# EasyEDA Pro project EtherCAT-RK3506.epro, schematic RK3506, sheets 11 to 12 of 12

## Sheets
11 4G: Create Date: 2026-10-26; Page Name: 4G; Schematic Name: RK3506; Update Date: 2026-10-27
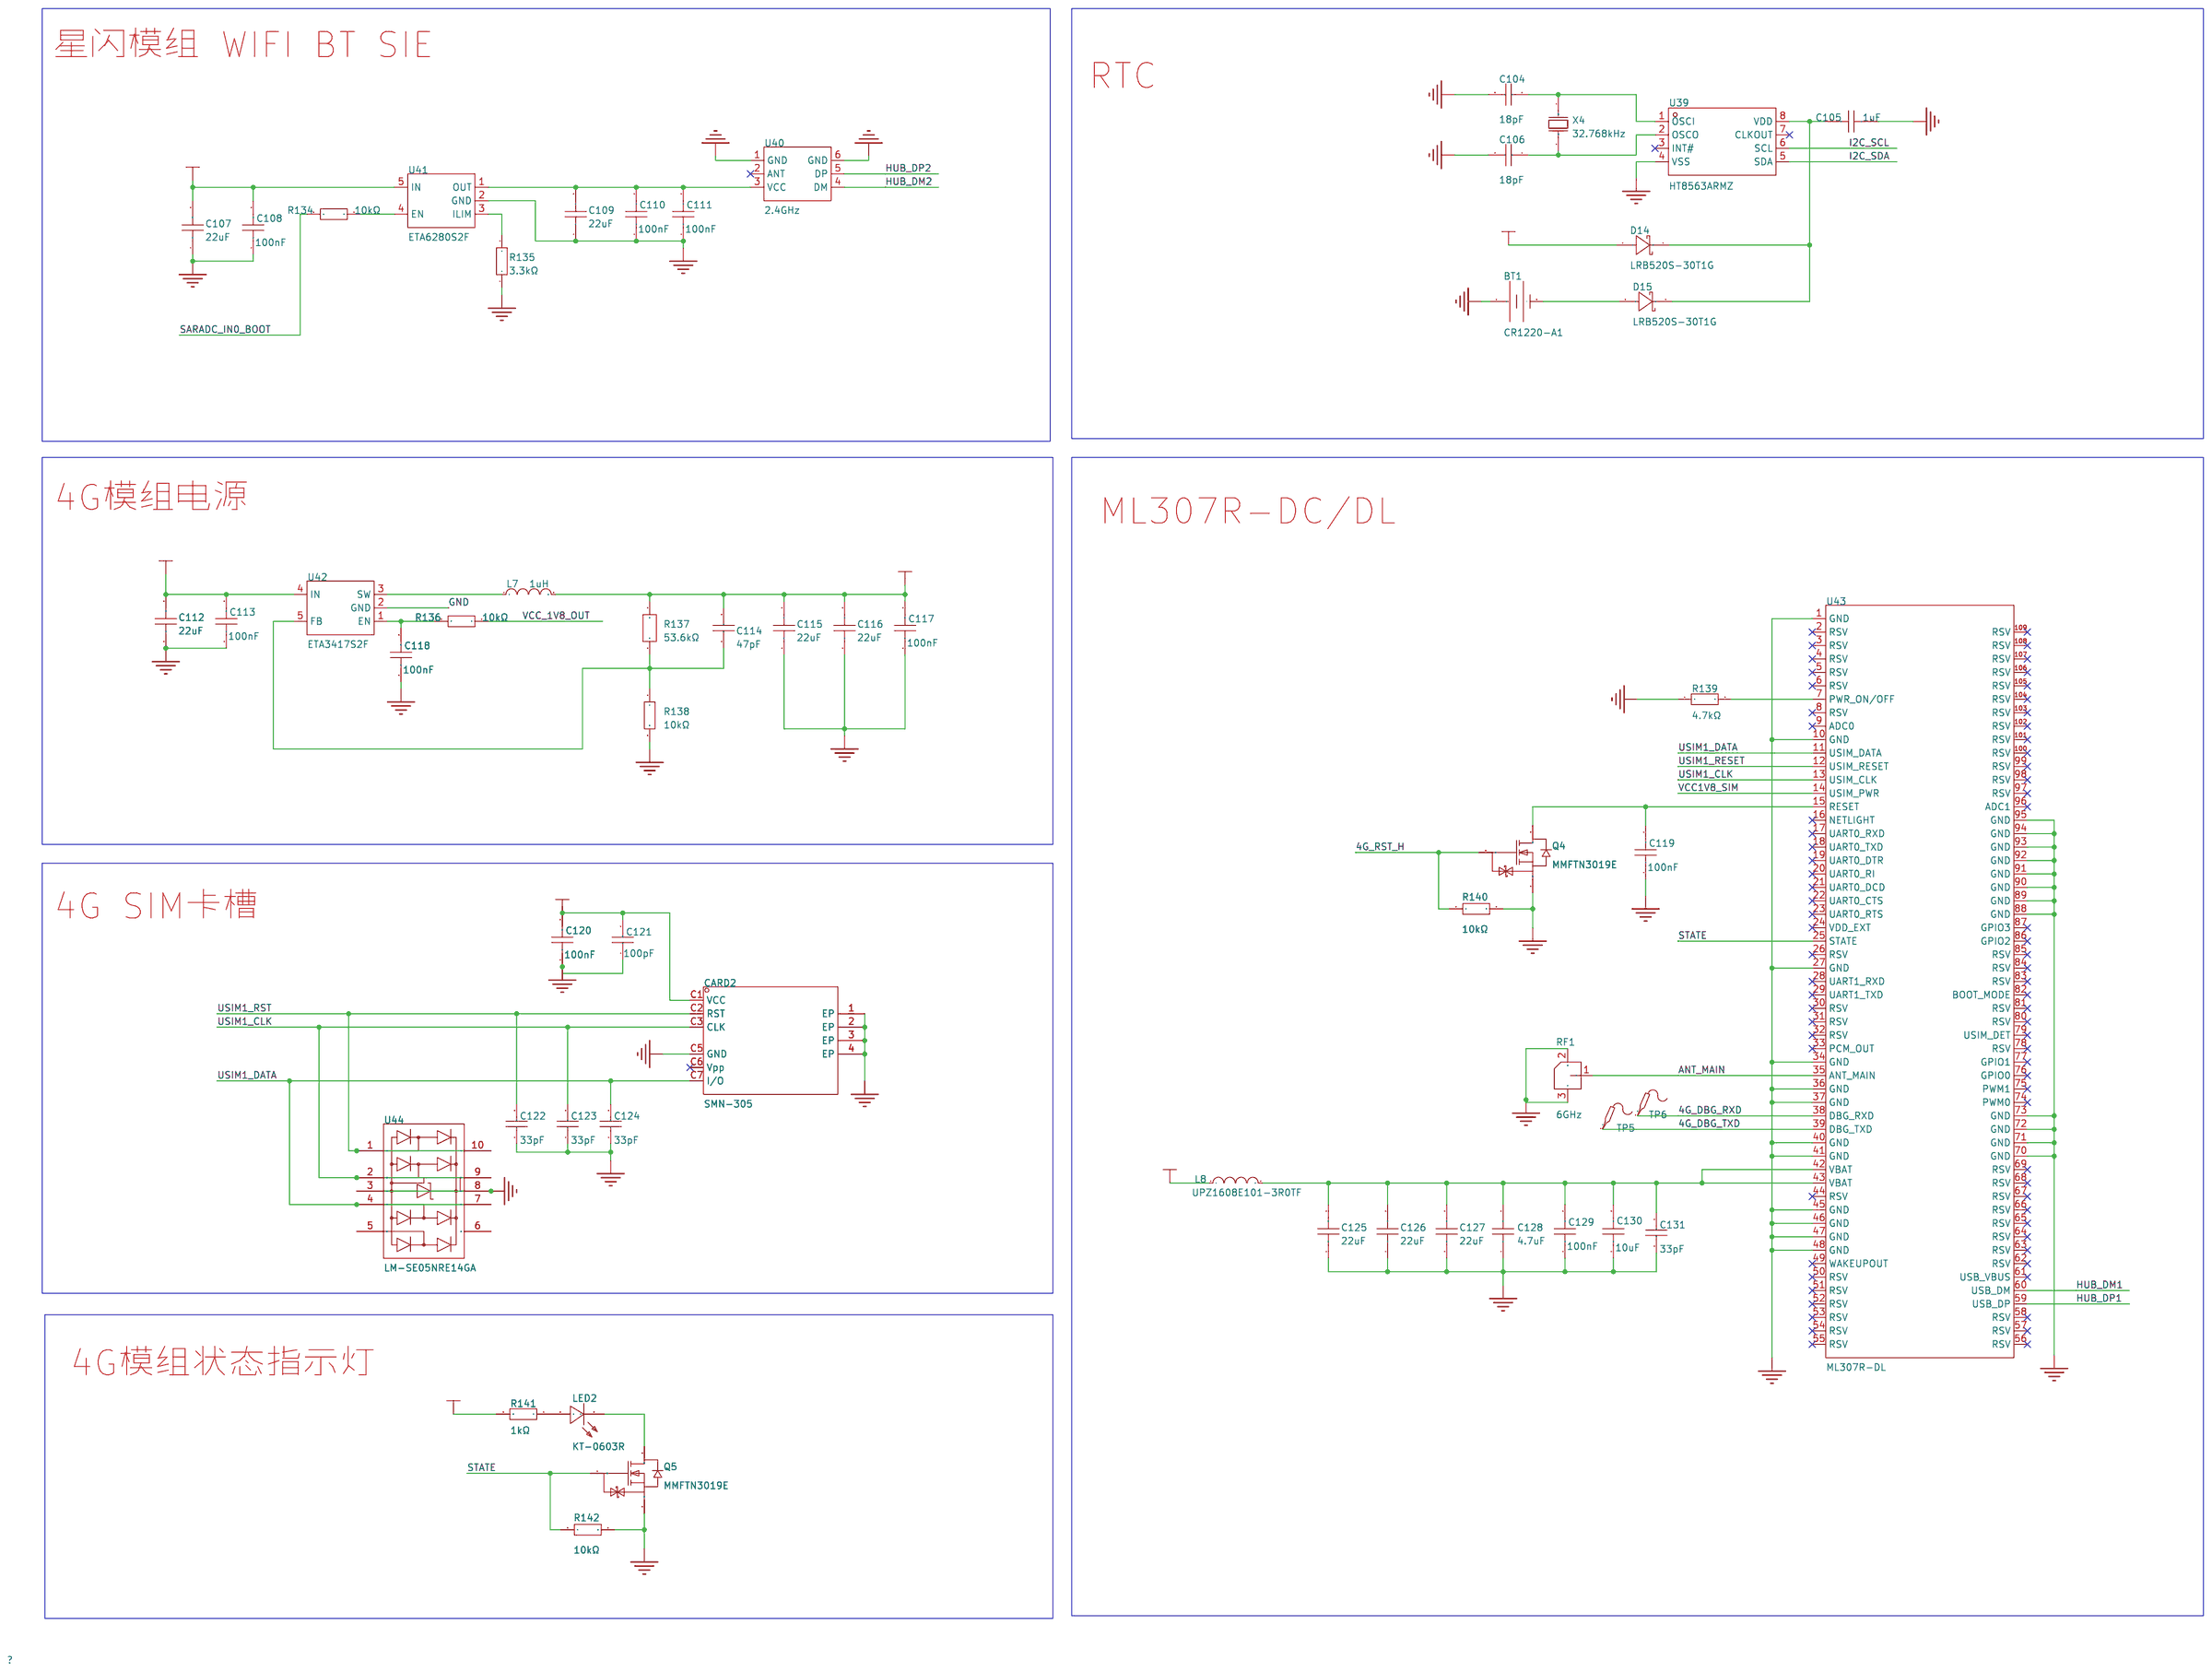
[diagram p10: 4G]
12 SD DEBUG: Create Date: 2026-10-27; Page Name: SD DEBUG; Schematic Name: RK3506; Update Date: 2026-10-27
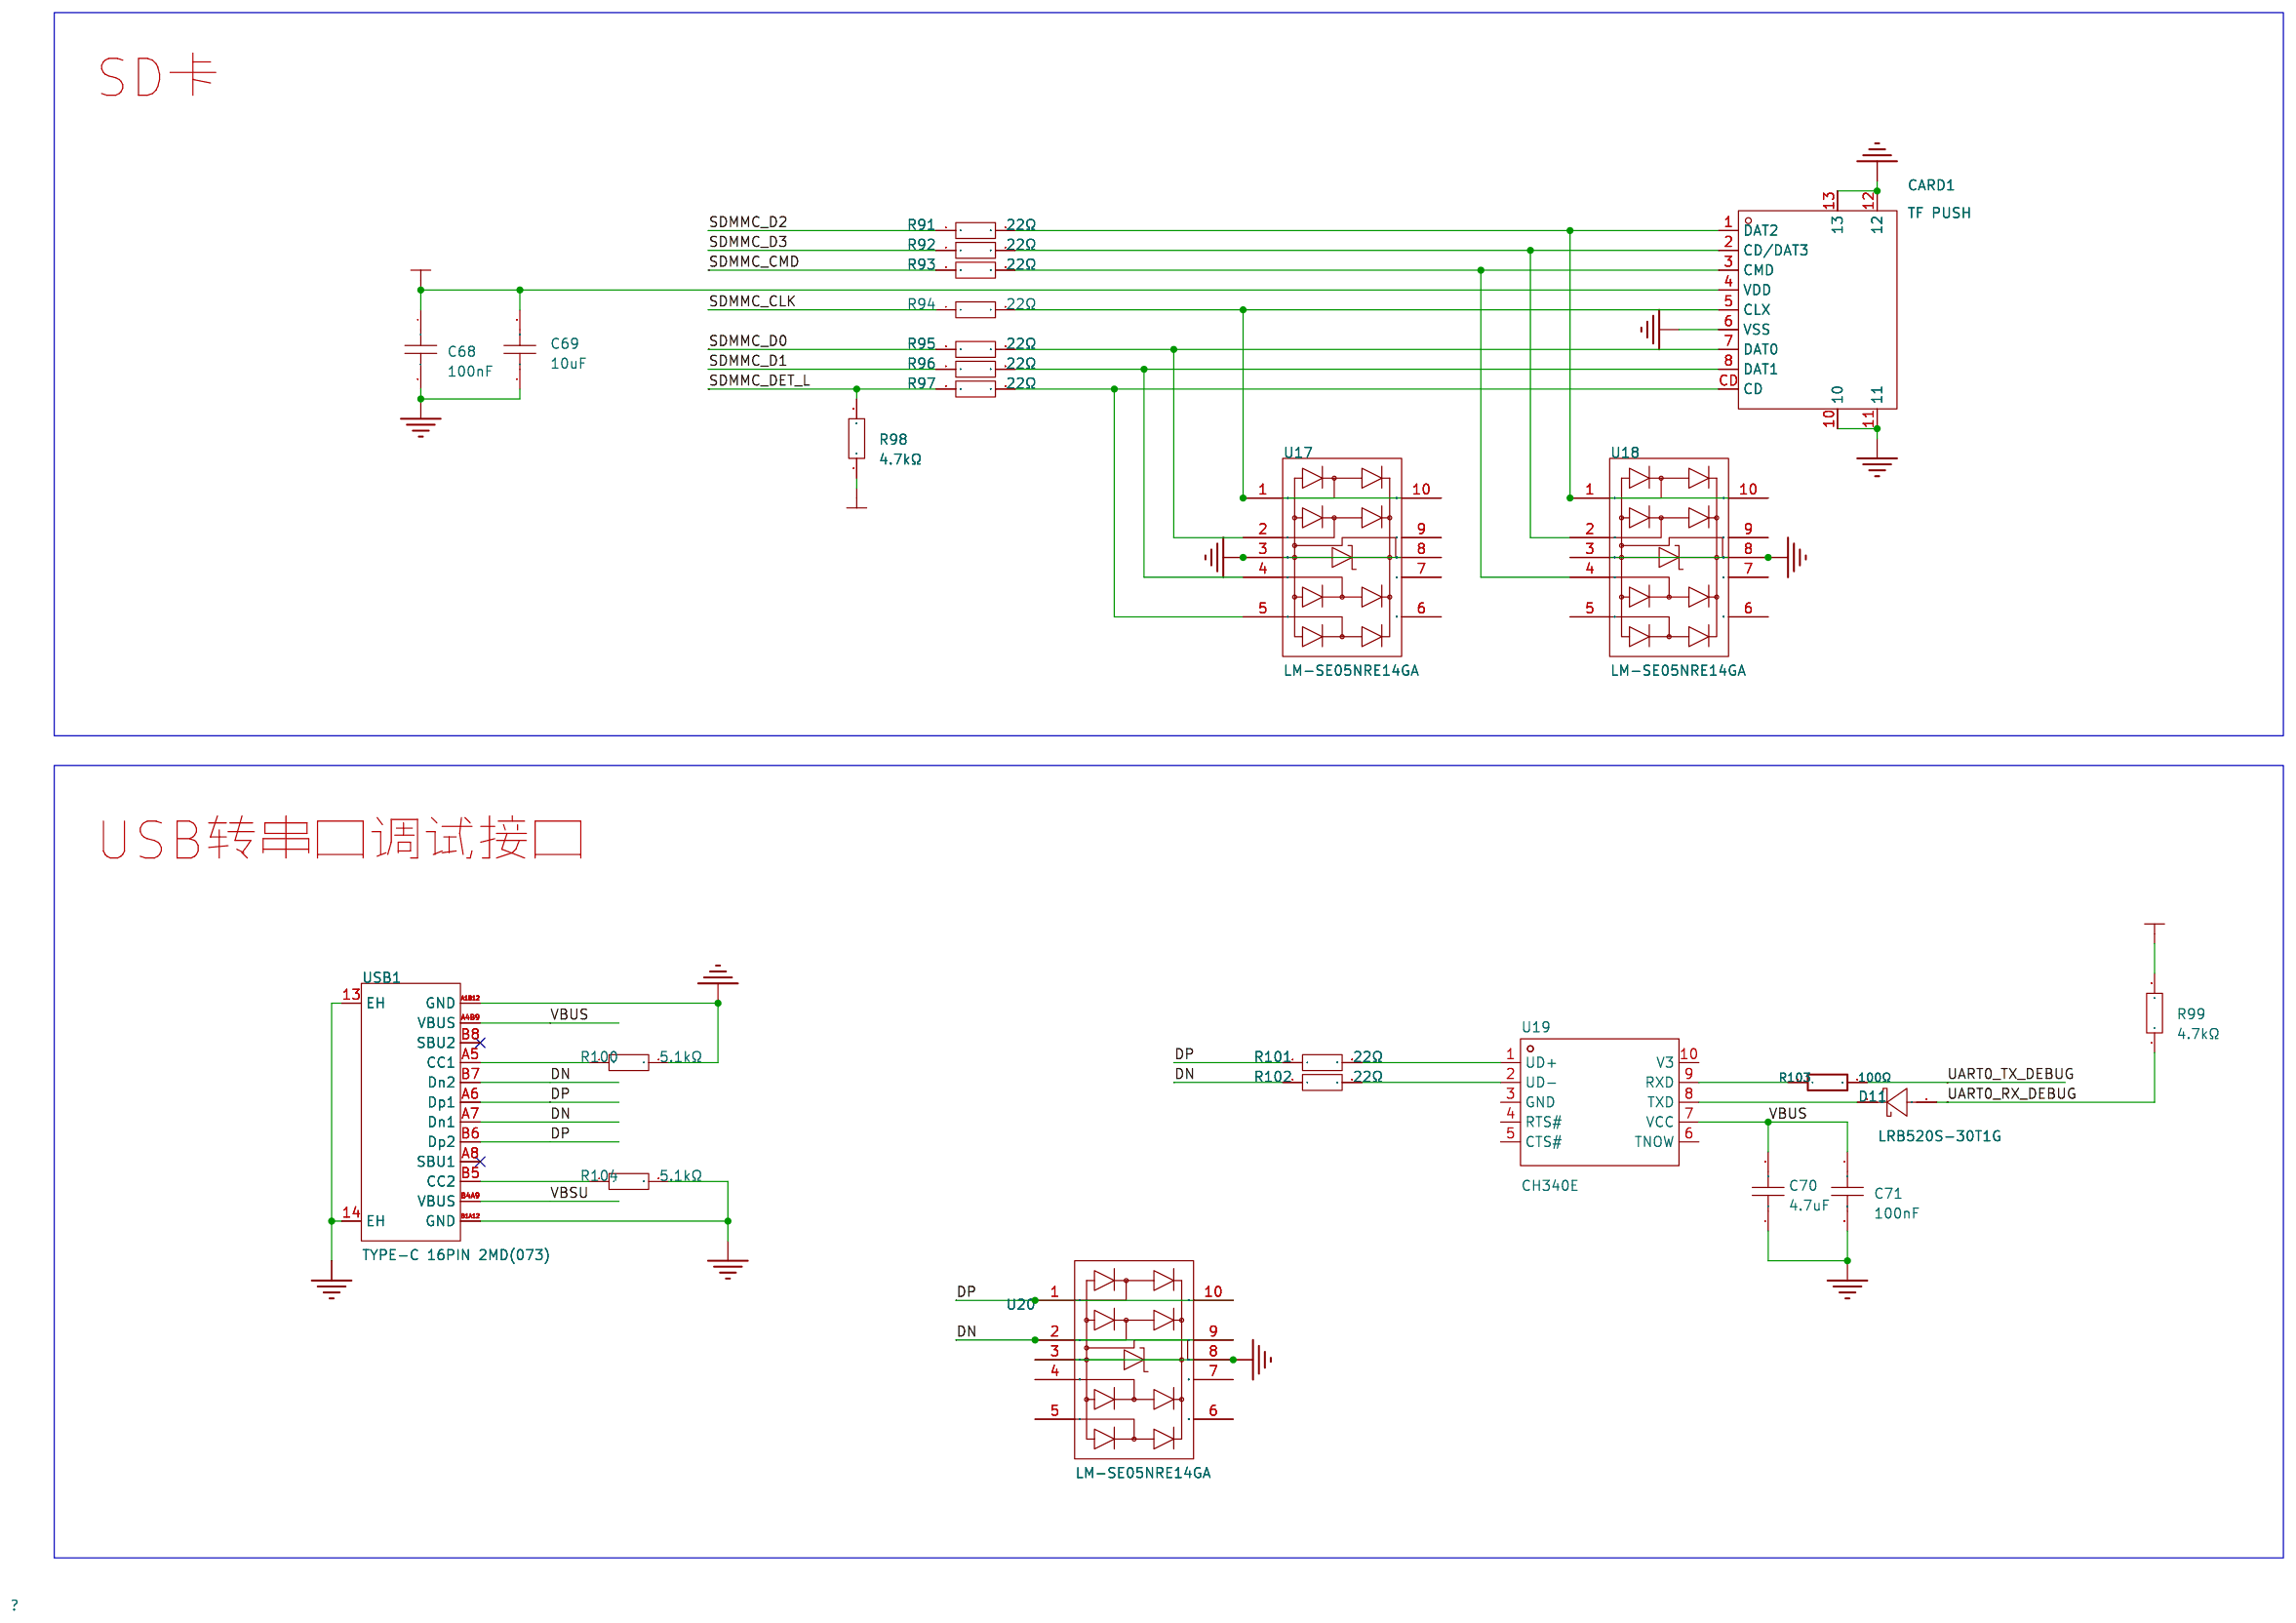
[diagram p11: SD DEBUG]

## Parts
sheet 4G
BT1  CR1220-A1  [BAT-SMD_CR1220-2]
C104  18pF  [C0402]
C105  1uF  [C0402]
C106  18pF  [C0402]
C107  22uF  [C0402]
C108  100nF  [C0402]
C109  22uF  [C0402]
C110  100nF  [C0402]
C111  100nF  [C0402]
C112  22uF  [C0402]
C113  100nF  [C0402]
C114  47pF  [C0402]
C115  22uF  [C0402]
C116  22uF  [C0402]
C117  100nF  [C0402]
C118  100nF  [C0402]
C119  100nF  [C0402]
C120  100nF  [C0402]
C121  100pF  [C0402]
C122  33pF  [C0402]
C123  33pF  [C0402]
C124  33pF  [C0402]
C125  22uF  [C0402]
C126  22uF  [C0402]
C127  22uF  [C0402]
C128  4.7uF  [C0402]
C129  100nF  [C0402]
C130  10uF  [C1206]
C131  33pF  [C0402]
CARD2  SMN-305  [SIM-SMD_SMN-305]
D14  LRB520S-30T1G  [SOD-523_L1.2-W0.8-LS1.6-RD-2]
D15  LRB520S-30T1G  [SOD-523_L1.2-W0.8-LS1.6-RD-2]
L7  1uH  [L0806]
L8  UPZ1608E101-3R0TF  [L0603]
LED2  KT-0603R  [LED-SMD_L1.6-W0.8-R-RD]
Q4  MMFTN3019E  [SOT-523-3_L1.6-W0.8-P1.00-LS1.6-BR]
Q5  MMFTN3019E  [SOT-523-3_L1.6-W0.8-P1.00-LS1.6-BR]
R134  10kΩ  [R0402]
R135  3.3kΩ  [R0402]
R136  10kΩ  [R0402]
R137  53.6kΩ  [R0402]
R138  10kΩ  [R0402]
R139  4.7kΩ  [R0402]
R140  10kΩ  [R0402]
R141  1kΩ  [R0402]
R142  10kΩ  [R0402]
RF1  6GHz  [IPEX-SMD_3P-L2.6-W2.6-LS3.0_RF1200001R]
TP5  -  [Test-Point-0.5mm]
TP6  -  [Test-Point-0.5mm]
U39  HT8563ARMZ  [MSOP-8_L3.0-W3.0-P0.65-LS4.9-BL]
U40  2.4GHz  [WIRELM-SMD_M573H-USBDG-NN]
U41  ETA6280S2F  [SOT-23-5_L3.0-W1.5-P0.95-LS2.8-BL]
U42  ETA3417S2F  [SOT-23-5_L2.9-W1.6-P0.95-LS2.8-BL]
U43  ML307R-DL  [LCC-LGA-109_L17.7-W15.8-P1.10_MC661]
U44  LM-SE05NRE14GA  [DFN2510-10_L2.5-W1.0-P0.50-BL]
X4  32.768kHz  [CRYSTAL-SMD_L3.2-W1.5-1]
sheet SD DEBUG
C68  100nF  [C0402]
C69  10uF  [C0603]
C70  4.7uF  [C0402]
C71  100nF  [C0402]
CARD1  TF PUSH  [TF-SMD_TF-PUSH]
D11  LRB520S-30T1G  [SOD-523_L1.2-W0.8-LS1.6-RD-2]
R91  22Ω  [R0402]
R92  22Ω  [R0402]
R93  22Ω  [R0402]
R94  22Ω  [R0402]
R95  22Ω  [R0402]
R96  22Ω  [R0402]
R97  22Ω  [R0402]
R98  4.7kΩ  [R0402]
R99  4.7kΩ  [R0402]
R100  5.1kΩ  [R0402]
R101  22Ω  [R0402]
R102  22Ω  [R0402]
R103  100Ω  [R0402]
R104  5.1kΩ  [R0402]
U17  LM-SE05NRE14GA  [DFN2510-10_L2.5-W1.0-P0.50-BL]
U18  LM-SE05NRE14GA  [DFN2510-10_L2.5-W1.0-P0.50-BL]
U19  CH340E  [MSOP-10_L3.0-W3.0-P0.50-LS5.0-BL]
U20  LM-SE05NRE14GA  [DFN2510-10_L2.5-W1.0-P0.50-BL]
USB1  TYPE-C 16PIN 2MD(073)  [USB-C-SMD_TYPE-C-16PIN-2MD-073]

## Library data of the parts
BT1 = CR1220-A1: Supplier Part: C48601334; Manufacturer: HanElectricity(瀚源); Supplier Footprint: SMD; JLCPCB Part Class: 扩展库; Datasheet: https://item.szlcsc.com/datasheet/CR1220-A1/50871511.html; Supplier: LCSC
C104 C106 = 0402CG180J500NT: 容值:18pF;精度:±5%;额定电压:50V;温度系数:C0G;; LCSC Part Name: 18pF ±5% 50V; Supplier Part: C1549; Manufacturer: FH(风华); Supplier Footprint: 0402; JLCPCB Part Class: 基础库; Datasheet: https://item.szlcsc.com/datasheet/0402CG180J500NT/1901.html; Supplier: LCSC; Tolerance: ±5%; Voltage Rating: 50V; Temperature Coefficient: C0G
C105 = CL05A105KA5NQNC: 容值:1uF;精度:±10%;额定电压:25V;温度系数:X5R;; LCSC Part Name: 1uF ±10% 25V; Supplier Part: C52923; Manufacturer: SAMSUNG(三星); Supplier Footprint: 0402; JLCPCB Part Class: 基础库; Datasheet: https://item.szlcsc.com/datasheet/CL05A105KA5NQNC/53938.html; Supplier: LCSC; Tolerance: ±10%; Voltage Rating: 25V; Temperature Coefficient: X5R
C107 C109 C112 C115 C116 C125-C127 = HGC0402R5226M100NTEJ: 容值:22uF;精度:±20%;额定电压:10V;温度系数:X5R;; LCSC Part Name: 22uF ±20% 10V; Supplier Part: C22367823; Manufacturer: Chinocera(华瓷); Supplier Footprint: 0402; JLCPCB Part Class: 扩展库; Datasheet: https://item.szlcsc.com/datasheet/HGC0402R5226M100NTEJ/23841128.html; Supplier: LCSC; Tolerance: ±20%; Voltage Rating: 10V; Temperature Coefficient: X5R
C68 C71 C108 C110 C111 C113 C117-C120 C129 = FCC0402B104K160AT: 容值:100nF;精度:±10%;额定电压:16V;温度系数:X7R;; LCSC Part Name: 100nF ±10% 16V; Supplier Part: C5137468; Manufacturer: FOJAN(富捷); Supplier Footprint: 0402; JLCPCB Part Class: 扩展库; Datasheet: https://item.szlcsc.com/datasheet/FCC0402B104K160AT/5746970.html; Supplier: LCSC; Tolerance: ±10%; Voltage Rating: 16V; Temperature Coefficient: X7R; Operating Temperature: -55℃~+125℃
C114 = 0402CG470J500NT: 容值:47pF;精度:±5%;额定电压:50V;温度系数:C0G;; LCSC Part Name: 47pF ±5% 50V; Supplier Part: C1567; Manufacturer: FH(风华); Supplier Footprint: 0402; JLCPCB Part Class: 基础库; Datasheet: https://item.szlcsc.com/datasheet/0402CG470J500NT/1919.html; Supplier: LCSC; Tolerance: ±5%; Voltage Rating: 50V; Temperature Coefficient: C0G
C121 = 0402CG101J500NT: 容值:100pF;精度:±5%;额定电压:50V;温度系数:C0G;; LCSC Part Name: 100pF ±5% 50V; Supplier Part: C1546; Manufacturer: FH(风华); Supplier Footprint: 0402; JLCPCB Part Class: 基础库; Datasheet: https://item.szlcsc.com/datasheet/0402CG101J500NT/1898.html; Supplier: LCSC; Tolerance: ±5%; Voltage Rating: 50V; Temperature Coefficient: C0G
C122-C124 C131 = 0402CG330J500NT: 容值:33pF;精度:±5%;额定电压:50V;温度系数:C0G;; LCSC Part Name: 33pF ±5% 50V; Supplier Part: C1562; Manufacturer: FH(风华); Supplier Footprint: 0402; JLCPCB Part Class: 基础库; Datasheet: https://item.szlcsc.com/datasheet/0402CG330J500NT/1914.html; Supplier: LCSC; Tolerance: ±5%; Voltage Rating: 50V; Temperature Coefficient: C0G
C70 C128 = CL05A475MP5NRNC: 容值:4.7uF;精度:±20%;额定电压:10V;温度系数:X5R;; LCSC Part Name: 4.7uF ±20% 10V; Supplier Part: C23733; Manufacturer: SAMSUNG(三星); Supplier Footprint: 0402; JLCPCB Part Class: 基础库; Datasheet: https://item.szlcsc.com/datasheet/CL05A475MP5NRNC/24469.html; Supplier: LCSC; Tolerance: ±20%; Voltage Rating: 10V; Temperature Coefficient: X5R
C130 = FCC1206X106K500HT: 容值:10uF;精度:±10%;额定电压:50V;温度系数:X5R;; LCSC Part Name: 10uF ±10% 50V; Supplier Part: C7467044; Manufacturer: FOJAN(富捷); Supplier Footprint: 1206; JLCPCB Part Class: 扩展库; Datasheet: https://item.szlcsc.com/datasheet/FCC1206X106K500HT/8513631.html; Supplier: LCSC; Tolerance: ±10%; Voltage Rating: 50V; Temperature Coefficient: X5R; Operating Temperature: -55℃~+85℃
CARD2 = SMN-305: 卡连接方式:翻盖式;卡类型:NanoSIM卡;连接器类型:卡座;本体最大高度:1.4mm;工作温度:-25℃~+85℃;; LCSC Part Name: 翻盖式 NanoSIM卡 卡座; Supplier Part: C266890; Manufacturer: XUNPU(讯普); Supplier Footprint: SMD; JLCPCB Part Class: 扩展库; Datasheet: https://item.szlcsc.com/datasheet/SMN-305/257001.html; Supplier: LCSC; Card Connection Mode: 翻盖式; Card Type: NanoSIM卡; Connector Type: 卡座; Card Detection: 无插卡检测; Height Above Board: 1.4mm; Rated Voltage (Max): 50V; Length: 14mm; Width: 12mm; Operating Temperature: -25℃~+85℃
D11 D14 D15 = LRB520S-30T1G_C52204749: 二极管配置:1个独立式;正向压降(Vf):600mV@200mA;直流反向耐压(Vr):30V;整流电流:200mA;; LCSC Part Name: 肖特基势垒二极管，适用于低电流整流和高速开关，表面贴装型，采用硅外延平面结构，开关速度快、正向电压低、反向电流小; Supplier Part: C52204749; Manufacturer: LRC(乐山无线电); Supplier Footprint: SOD-523; JLCPCB Part Class: 扩展库; Datasheet: https://item.szlcsc.com/datasheet/LRB520S-30T1G/55045632.html; Supplier: LCSC; Diode Configuration: 1个独立式; Voltage - Forward(Vf@If): 600mV@200mA; Voltage - DC Reverse(Vr): 30V; Current - Rectified: 200mA; Reverse Leakage Current (Ir): 1uA@10V; Non-Repetitive Peak Forward Surge Current: 1A
L7 = DFE201612E-1R0M=P2: 电感值:1uH;精度:±20%;额定电流:2.9A;饱和电流(Isat):4A;类型:-;; LCSC Part Name: 1uH ±20% 4A; Supplier Part: C337892; Manufacturer: muRata(村田); Supplier Footprint: 0806; JLCPCB Part Class: 扩展库; Datasheet: https://item.szlcsc.com/datasheet/DFE201612E-1R0M%253DP2/315672.html; Supplier: LCSC; Tolerance: ±20%; Current Rating: 2.9A; Current - Saturation(Isat): 4A; DC Resistance(DCR): 48mΩ
L8 = UPZ1608E101-3R0TF: 阻抗@频率:100Ω@100MHz;误差:±25%;直流电阻(DCR):30mΩ;; LCSC Part Name: 单路 0603磁珠 阻抗100Ω@100MHz; Supplier Part: C96995; Manufacturer: Sunlord(顺络); Supplier Footprint: 0603; JLCPCB Part Class: 扩展库; Datasheet: https://item.szlcsc.com/datasheet/UPZ1608E101-3R0TF/98200.html; Supplier: LCSC; Impedance @ Frequency: 100Ω@100MHz; Tolerance: ±25%; DC Resistance(DCR): 30mΩ; Current Rating: 3A; Number of Circuits: 1; Operating Temperature: -55℃~+125℃
LED2 = KT-0603R: 灯头类型:1.6mmx0.8mm方形灯头;发光颜色:红色;正向压降(Vf):1.8V~2.4V;功率:40mW;正向电流:20mA;波长:615nm~630nm;二极管配置:独立二极管;透镜颜色:无色透明透镜;色温:-;发光强度:300mcd;发光角度:120°;载带方式:-;工作温度:-40℃~+85℃;; LCSC Part Name: 0603 红灯 高亮; Supplier Part: C2286; Manufacturer: KENTO; Supplier Footprint: 0603; JLCPCB Part Class: 基础库; Datasheet: https://item.szlcsc.com/datasheet/KT-0603R/2659.html; Supplier: LCSC; Lamp Holder Type: 1.6mmx0.8mm方形灯头; Illumination Color: 红色; Voltage - Forward(Vf): 1.8V~2.4V; Power(Watts): 40mW; Forward Current: 20mA; Wavelength - Dominant: 615nm~630nm; Peak Wavelength: 645nm; Diode Configuration: 独立二极管; Lens Color: 无色透明透镜; Luminous Intensity: 300mcd; Viewing Angle: 120°; Operating Temperature: -40℃~+85℃
Q4 Q5 = MMFTN3019E: 数量:1个N沟道;漏源电压(Vdss):30V;连续漏极电流(Id):100mA;导通电阻(RDS(on)):8Ω@4V;耗散功率(Pd):150mW;阈值电压(Vgs(th)):1.5V;; LCSC Part Name: 1个N沟道 耐压:30V 电流:100mA; Supplier Part: C86709; Manufacturer: ST(先科); Supplier Footprint: SOT-523-3; JLCPCB Part Class: 扩展库; Datasheet: https://item.szlcsc.com/datasheet/MMFTN3019E/87886.html; Supplier: LCSC; Number: 1个N沟道; Drain to Source Voltage: 30V; Current - Continuous Drain(Id): 100mA; RDS(on): 8Ω@4V; Pd - Power Dissipation: 150mW; Gate Threshold Voltage (Vgs(th)): 1.5V; Input Capacitance(Ciss): 13pF; Reverse Transfer Capacitance (Crss@Vds): 4pF; Type: N沟道; Output Capacitance(Coss): 9pF; Vgs: ±20V
R134 R136 R138 R140 R142 = 0402WGF1002TCE: 电阻类型:厚膜电阻;阻值:10kΩ;精度:±1%;功率:62.5mW;工作电压:50V;温度系数:±100ppm/℃;; LCSC Part Name: 厚膜电阻 10kΩ ±1%; Supplier Part: C25744; Manufacturer: UNI-ROYAL(厚声); Supplier Footprint: 0402; JLCPCB Part Class: 基础库; Datasheet: https://item.szlcsc.com/datasheet/0402WGF1002TCE/26487.html; Supplier: LCSC; Type: 厚膜电阻; Tolerance: ±1%; Power(Watts): 62.5mW; Voltage-Supply(Max): 50V; Temperature Coefficient: ±100ppm/℃; Operating Temperature: -55℃~+155℃
R135 = 0402WGF3301TCE: 电阻类型:厚膜电阻;阻值:3.3kΩ;精度:±1%;功率:62.5mW;工作电压:50V;温度系数:±100ppm/℃;; LCSC Part Name: 厚膜电阻 3.3kΩ ±1%; Supplier Part: C25890; Manufacturer: UNI-ROYAL(厚声); Supplier Footprint: 0402; JLCPCB Part Class: 基础库; Datasheet: https://item.szlcsc.com/datasheet/0402WGF3301TCE/26633.html; Supplier: LCSC; Type: 厚膜电阻; Tolerance: ±1%; Power(Watts): 62.5mW; Voltage-Supply(Max): 50V; Temperature Coefficient: ±100ppm/℃; Operating Temperature: -55℃~+155℃
R137 = FRC0402F5362TS: 电阻类型:厚膜电阻;阻值:53.6kΩ;精度:±1%;功率:62.5mW;工作电压:50V;温度系数:±100ppm/℃;; LCSC Part Name: 53.6kΩ ±1% 62.5mW 厚膜电阻; Supplier Part: C5153961; Manufacturer: FOJAN(富捷); Supplier Footprint: 0402; JLCPCB Part Class: 扩展库; Datasheet: https://item.szlcsc.com/datasheet/FRC0402F5362TS/5781089.html; Supplier: LCSC; Type: 厚膜电阻; Tolerance: ±1%; Power(Watts): 62.5mW; Voltage-Supply(Max): 50V; Temperature Coefficient: ±100ppm/℃; Operating Temperature: -55℃~+155℃
R98 R99 R139 = 0402WGF4701TCE: 电阻类型:厚膜电阻;阻值:4.7kΩ;精度:±1%;功率:62.5mW;工作电压:50V;温度系数:±100ppm/℃;; LCSC Part Name: 厚膜电阻 4.7kΩ ±1%; Supplier Part: C25900; Manufacturer: UNI-ROYAL(厚声); Supplier Footprint: 0402; JLCPCB Part Class: 基础库; Datasheet: https://item.szlcsc.com/datasheet/0402WGF4701TCE/26643.html; Supplier: LCSC; Type: 厚膜电阻; Tolerance: ±1%; Power(Watts): 62.5mW; Voltage-Supply(Max): 50V; Temperature Coefficient: ±100ppm/℃; Operating Temperature: -55℃~+155℃
R141 = 0402WGF1001TCE: 电阻类型:厚膜电阻;阻值:1kΩ;精度:±1%;功率:62.5mW;工作电压:50V;温度系数:±100ppm/℃;; LCSC Part Name: 厚膜电阻 1kΩ ±1%; Supplier Part: C11702; Manufacturer: UNI-ROYAL(厚声); Supplier Footprint: 0402; JLCPCB Part Class: 基础库; Datasheet: https://item.szlcsc.com/datasheet/0402WGF1001TCE/12256.html; Supplier: LCSC; Type: 厚膜电阻; Tolerance: ±1%; Power(Watts): 62.5mW; Voltage-Supply(Max): 50V; Temperature Coefficient: ±100ppm/℃; Operating Temperature: -55℃~+155℃
RF1 = IPEX-1_C47986640: 连接器类型:板端;接口类型:内针;端口数量:1;接口直径:2mm;接口长度/高度:1.25mm;频率:6GHz;射频系列:IPEX;阻抗:50Ω;工作温度:-40℃~+85℃;; LCSC Part Name: 内针 IPEX; Supplier Part: C47986640; Manufacturer: HanElectricity(瀚源); Manufacturer Part: IPEX-1; Supplier Footprint: SMD; JLCPCB Part Class: 扩展库; Datasheet: https://item.szlcsc.com/datasheet/IPEX-1/50223057.html; Supplier: LCSC; Connector Type: 板端; Interface: 内针; Number of Ports: 1; Interface Diameter: 2mm; Interface Length/Height: 1.25mm; RF Series: IPEX; Impedance: 50Ω; Rated Voltage (Max): 60V; Operating Temperature Range: -40℃~+85℃
TP5 TP6 = Test-Point: Test Point 测试点
U39 = HT8563ARMZ: 接口类型:I2C;晶振类型:外置;闹钟输出:有;; LCSC Part Name: CMOS实时时钟/日历; Supplier Part: C5143012; Manufacturer: HTCSEMI(海天芯); Supplier Footprint: MSOP-8; JLCPCB Part Class: 扩展库; Datasheet: https://item.szlcsc.com/datasheet/HT8563ARMZ/5761262.html; Supplier: LCSC; Interface: I2C; crystal oscillator: 外置; Alarm Output: 有; Current - Supply: 450nA; Voltage - Supply: 1.8V~5.5V; Quiescent Current(Iq): 0.45uA; Operating Temperature: -40℃~+85℃; Features: 倒数计时器；告警功能；电池低压检测；周期性中断输出；可编程时钟输出
U40 = M573H-USBDG-NN: 频率:2.4GHz;发射功率:16dBm;接收灵敏度:-88dBm;; LCSC Part Name: 星闪模组; Supplier Part: C54321644; Manufacturer: 如般微; Supplier Footprint: SMD,13x12mm; JLCPCB Part Class: 扩展库; Datasheet: https://item.szlcsc.com/datasheet/M573H-USBDG-NN/57612387.html; Supplier: LCSC; Wireless Standard: IEEE802.11b/g/n/ax；Bluetooth5.2；SLE1.0; Interface Type: USB; Output Power: 16dBm; Voltage - Supply: 3V~3.6V; Sensitivity: -88dBm; Operating Temperature: -35℃~+70℃
U41 = ETA6280S2F: 类型:负载开关;通道数:1;输入控制逻辑:高电平有效;工作电压:2.1V~6V;最大连续电流:2.2A;导通电阻:70mΩ;; LCSC Part Name: 可编程电流限制负载开关; Supplier Part: C7465543; Manufacturer: ETA(钰泰); Supplier Footprint: SOT23-5; JLCPCB Part Class: 扩展库; Datasheet: https://item.szlcsc.com/datasheet/ETA6280S2F/8507080.html; Supplier: LCSC; Type: 负载开关; Number of Channels: 1; Control Input Logic: 高电平有效; Voltage - Supply: 2.1V~6V; Maximum Continuous Current: 2.2A; RDS(on): 70mΩ; Features: 过温保护；过流保护；短路保护；反向电流阻断；输出放电功能；过压保护；欠压锁定; Operating Temperature	-: -40℃~+85℃
U42 = ETA3417S2F: 功能类型:降压型;工作电压:2.6V~7V;输出电压:600mV~7V;输出电流:2.5A;输出类型:可调;; LCSC Part Name: 降压型 2.5A 2.6V~7V; Supplier Part: C7465507; Manufacturer: ETA(钰泰); Supplier Footprint: SOT23-5; JLCPCB Part Class: 扩展库; Datasheet: https://item.szlcsc.com/datasheet/ETA3417S2F/8507044.html; Supplier: LCSC; Function: 降压型; Voltage - Supply: 2.6V~7V; Output Voltage: 600mV~7V; Output Current: 2.5A; Frequency - Switching: 3MHz; Operating Temperature: -40℃~+85℃; Synchronous Rectifier: 是; Number of Outputs: 1; Topology: 降压式; Quiescent Current: 32uA; Switch tube (built-in/external): 内置; Output Type: 可调; Features: 逐波限流；过流保护；EMI优化(抖频模式)
U43 = ML307R-DL_C48982537: 通信制式:TDD-LTE；FDD-LTE;接口类型:PWM；UART；USB；GPIO；ADC;工作频段:B40；B34；B3；B5；B41；B39；B8；B38；B1;; LCSC Part Name: LTE Cat.1模组; Supplier Part: C48982537; Manufacturer: Chinamobile(中移物联网); Supplier Footprint: SMD,17.7x15.8mm; JLCPCB Part Class: 扩展库; Datasheet: https://item.szlcsc.com/datasheet/ML307R-DL/51313686.html; Supplier: LCSC; Communication System: TDD-LTE；FDD-LTE; Interface: PWM；UART；USB；GPIO；ADC; Communication Frequency: B40；B34；B3；B5；B41；B39；B8；B38；B1; Voltage - Supply: 3.4V~4.5V; Features: PCM语音功能; Operating Temperature: -30℃~+75℃
U17 U18 U20 U44 = LM-SE05NRE14GA: 反向截止电压(Vrwm):5V;钳位电压:15V;击穿电压(VBR):6V;; LCSC Part Name: ESD 5V截止; Supplier Part: C5310700; Manufacturer: Leiditech(雷卯电子); Supplier Footprint: DFN2510-10; JLCPCB Part Class: 扩展库; Datasheet: https://item.szlcsc.com/datasheet/LM-SE05NRE14GA/6066343.html; Supplier: LCSC; Reverse Stand-Off Voltage (Vrwm): 5V; Clamping Voltage: 15V; Voltage - Breakdown: 6V; Reverse Leakage Current (Ir): 100nA; Number of Channels: 四路; level of protection: IEC 61000-4-5；IEC 61000-4-2; Type: ESD; Junction Capacitance: 0.3pF
X4 = XKXGI-SUA-32.768K: 晶振类型:贴片晶振;频率:32.768kHz;常温频差:±20ppm;负载电容:12.5pF;频率稳定度:±30ppm;; LCSC Part Name: YST310S 32.768KHZ 2P 3215 12.5PF ±20PPM -40~85℃; Supplier Part: C5213671; Manufacturer: YXC(扬兴晶振); Supplier Footprint: SMD3215-2P; JLCPCB Part Class: 扩展库; Datasheet: https://item.szlcsc.com/datasheet/XKXGI-SUA-32.768K/5908943.html; Supplier: LCSC; Type: 贴片晶振; Normal temperature Frequency Tolerance: ±20ppm; Load Capacitance: 12.5pF; Frequency Stability: ±30ppm; Equivalent Series Resistance(ESR): 70kΩ; Operating Temperature: -40℃~+85℃
C69 = CL10A106KP8NNNC: 容值:10uF;精度:±10%;额定电压:10V;温度系数:X5R;; LCSC Part Name: 10uF ±10% 10V; Supplier Part: C19702; Manufacturer: SAMSUNG(三星); Supplier Footprint: 0603; JLCPCB Part Class: 基础库; Datasheet: https://item.szlcsc.com/datasheet/CL10A106KP8NNNC/20411.html; Supplier: LCSC; Tolerance: ±10%; Voltage Rating: 10V; Temperature Coefficient: X5R
CARD1 = TF PUSH: 卡连接方式:自弹式;卡类型:MicroSD卡(TF卡);连接器类型:卡座;本体最大高度:2mm;工作温度:-25℃~+85℃;; LCSC Part Name: 自弹式 MicroSD卡(TF卡) 卡座; Supplier Part: C393941; Manufacturer: SHOU HAN(首韩); Supplier Footprint: SMD; JLCPCB Part Class: 扩展库; Datasheet: https://item.szlcsc.com/datasheet/TF%2520PUSH/372553.html; Supplier: LCSC; Card Connection Mode: 自弹式; Card Type: MicroSD卡(TF卡); Connector Type: 卡座; Additional Card Detection Pins: 有; Height Above Board: 2mm; Operating Temperature: -25℃~+85℃; Length: 14.75mm; Width: 14.5mm
R91-R97 R101 R102 = 0402WGF220JTCE: 电阻类型:厚膜电阻;阻值:22Ω;精度:±1%;功率:62.5mW;最大工作电压:50V;温度系数:±100ppm/℃;; LCSC Part Name: 22Ω ±1% 62.5mW 厚膜电阻; Supplier Part: C25092; Manufacturer: UNI-ROYAL(厚声); Supplier Footprint: 0402; JLCPCB Part Class: 基础库; Datasheet: https://atta.szlcsc.com/upload/public/pdf/source/20200306/C422600_1E6D84923E4A46A82E41ADD87F860B5C.pdf; Supplier: LCSC; Type: 厚膜电阻; Tolerance: ±1%; Power(Watts): 62.5mW; Overload Voltage (Max): 50V; Temperature Coefficient: ±100ppm/℃; Operating Temperature Range: -55℃~+155℃
R100 R104 = 0402WGF5101TCE: 电阻类型:厚膜电阻;阻值:5.1kΩ;精度:±1%;功率:62.5mW;工作电压:50V;温度系数:±100ppm/℃;; LCSC Part Name: 厚膜电阻 5.1kΩ ±1%; Supplier Part: C25905; Manufacturer: UNI-ROYAL(厚声); Supplier Footprint: 0402; JLCPCB Part Class: 基础库; Datasheet: https://item.szlcsc.com/datasheet/0402WGF5101TCE/26648.html; Supplier: LCSC; Type: 厚膜电阻; Tolerance: ±1%; Power(Watts): 62.5mW; Voltage-Supply(Max): 50V; Temperature Coefficient: ±100ppm/℃; Operating Temperature: -55℃~+155℃
R103 = 0402WGF1000TCE: 电阻类型:厚膜电阻;阻值:100Ω;精度:±1%;功率:62.5mW;工作电压:50V;温度系数:±100ppm/℃;; LCSC Part Name: 厚膜电阻 100Ω ±1%; Supplier Part: C25076; Manufacturer: UNI-ROYAL(厚声); Supplier Footprint: 0402; JLCPCB Part Class: 基础库; Datasheet: https://item.szlcsc.com/datasheet/0402WGF1000TCE/25819.html; Supplier: LCSC; Type: 厚膜电阻; Tolerance: ±1%; Power(Watts): 62.5mW; Voltage-Supply(Max): 50V; Temperature Coefficient: ±100ppm/℃; Operating Temperature: -55℃~+155℃
U19 = CH340E: 应用功能:收发器;USB协议版本:USB 2.0;数据速率:2Mbps;; LCSC Part Name: USB转串口芯片CH340; Supplier Part: C99652; Manufacturer: WCH(南京沁恒); Supplier Footprint: MSOP-10; JLCPCB Part Class: 扩展库; Datasheet: https://item.szlcsc.com/datasheet/CH340E/100866.html; Supplier: LCSC; Applications Function: 收发器; USB Protocol: USB 2.0; Voltage - Supply: 3.3V；5V; Data Rate: 2Mbps; Current - Supply: 20mA; Quiescent Supply Current: 150uA; Features: 可编程波特率；内置时钟发生器；上电复位
USB1 = TYPE-C 16PIN 2MD(073): 连接器类型:Type-C;协议标准:-;公母:母;安装方式:卧贴;触点数量:16P;端口数量:1;额定电流 - 电源:3A;工作温度:-25℃~+85℃;; LCSC Part Name: Type-C 母 卧贴; Supplier Part: C2765186; Manufacturer: SHOU HAN(首韩); Supplier Footprint: SMD; JLCPCB Part Class: 扩展库; Datasheet: https://item.szlcsc.com/datasheet/TYPE-C%252016PIN%25202MD(073)/2901843.html; Supplier: LCSC; Connector Type: Type-C; Gender: 母; Mounting Type: 卧贴; Number of Contacts: 16P; Number of Ports: 1; Current Rating-Power: 3A; Voltage Rating: 5V; Connect-Disconnect Life: 1万次; Length: 7.35mm; Detection color: 黑色; Operating Temperature: -25℃~+85℃

## Nets
GND: BT1.1(+) C68.2 C69.1 C70.1 C71.2 C104.2 C105.1 C106.2 C107.1 C108.1 C109.1 C110.1 C111.1 C112.1 C113.1 C115.1 C116.1 C117.1 C118.1 C119.1 C120.1 C121.1 C122.1 C123.1 C124.1 C125.1 C126.1 C127.1 C128.1 C129.1 C130.1 C131.1 CARD1.6(VSS) CARD1.10 CARD1.11 CARD1.12 CARD1.13 CARD2.1(EP) CARD2.2(EP) CARD2.3(EP) CARD2.4(EP) CARD2.C5(GND) Q4.2(S) Q5.2(S) R100.2 R104.2 R135.1 R138.2 R139.1 R140.2 R142.2 RF1.2 RF1.3 U17.3(GND) U17.8(GND) U18.3(GND) U18.8(GND) U20.3(GND) U20.8(GND) U39.4(VSS) U40.1(GND) U40.6(GND) U41.2(GND) U42.2(GND) U43.1(GND) U43.10(GND) U43.27(GND) U43.34(GND) U43.36(GND) U43.37(GND) U43.40(GND) U43.41(GND) U43.45(GND) U43.46(GND) U43.47(GND) U43.48(GND) U43.70(GND) U43.71(GND) U43.72(GND) U43.73(GND) U43.88(GND) U43.89(GND) U43.90(GND) U43.91(GND) U43.92(GND) U43.93(GND) U43.94(GND) U43.95(GND) U44.3(GND) U44.8(GND) USB1.13(EH) USB1.14(EH) USB1.A1B12(GND) USB1.B1A12(GND) ; also on sheet 3 4 5 6 7 8 9 10
VBUS: C70.2 C71.1 U19.7(VCC) USB1.A4B9(VBUS)
VCC1V8_SIM: C120.2 C121.2 CARD2.C1(VCC) U43.14(USIM_PWR)
VCC3V3: C68.1 C69.2 C107.2 C108.2 CARD1.4(VDD) D14.2(A) R99.2 R141.2 U41.5(IN) ; also on sheet 3 4 5 6 7 8 9
VCC3V8: C114.2 C115.2 C116.2 C117.2 L7.2 L8.1 R137.2
VCC5V_SYS: C112.2 C113.2 U42.4(IN) ; also on sheet 3 4 8
VCC_1V8_OUT: R98.1 R136.1 ; also on sheet 4 8 10
4G_DBG_RXD: TP6.1 U43.38(DBG_RXD)
4G_DBG_TXD: TP5.1 U43.39(DBG_TXD)
4G_RST_H: Q4.1(G) R140.1 ; also on sheet 4
ANT_MAIN: RF1.1 U43.35(ANT_MAIN)
DN: R102.1 U20.2(I/O) U20.9(NC) USB1.A7(Dn1) USB1.B7(Dn2)
DP: R101.1 U20.1(I/O) U20.10(NC) USB1.A6(Dp1) USB1.B6(Dp2)
HUB_DM1: U43.60(USB_DM) ; also on sheet 8
HUB_DM2: U40.4(DM) ; also on sheet 8
HUB_DP1: U43.59(USB_DP) ; also on sheet 8
HUB_DP2: U40.5(DP) ; also on sheet 8
I2C_SCL: U39.6(SCL) ; also on sheet 4 7 9
I2C_SDA: U39.5(SDA) ; also on sheet 4 7 9
SARADC_IN0_BOOT: R134.2 ; also on sheet 4
SDMMC_CLK: R94.1 ; also on sheet 4
SDMMC_CMD: R93.1 ; also on sheet 4
SDMMC_D0: R95.1 ; also on sheet 4
SDMMC_D1: R96.1 ; also on sheet 4
SDMMC_D2: R91.1 ; also on sheet 4
SDMMC_D3: R92.1 ; also on sheet 4
SDMMC_DET_L: R97.1 R98.2 ; also on sheet 4
STATE: Q5.1(G) R142.1 U43.25(STATE)
UART0_RX_DEBUG: D11.2(A) R99.1 ; also on sheet 4
UART0_TX_DEBUG: R103.2
USIM1_CLK: C123.2 CARD2.C3(CLK) U43.13(USIM_CLK) U44.2(I/O) U44.9(NC)
USIM1_DATA: C124.2 CARD2.C7(I/O) U43.11(USIM_DATA) U44.4(I/O) U44.7(NC)
USIM1_RESET: U43.12(USIM_RESET)
USIM1_RST: C122.2 CARD2.C2(RST) U44.1(I/O) U44.10(NC)
VBSU: USB1.B4A9(VBUS)
$11N348: C118.2 R136.2 U42.1(EN)
$11N779: C114.1 R137.1 R138.1 U42.5(FB)
$11N2528: L7.1 U42.3(SW)
$11N3871: R139.2 U43.7(PWR_ON/OFF)
$11N3949: C119.2 Q4.3(D) U43.15(RESET)
$11N5376: LED2.1(A) R141.1
$11N5383: LED2.2(K) Q5.3(D)
$11N5869: C125.2 C126.2 C127.2 C128.2 C129.2 C130.2 C131.2 L8.2 U43.42(VBAT) U43.43(VBAT)
$11N6410: R134.1 U41.4(EN)
$11N6417: C109.2 C110.2 C111.2 U40.3(VCC) U41.1(OUT)
$11N6429: R135.2 U41.3(ILIM)
$11N6762: C104.1 U39.1(OSCI) X4.1(OSC1)
$11N6897: C106.1 U39.2(OSCO) X4.2(OSC2)
$11N7386: BT1.2(-) D15.2(A)
$11N7394: C105.2 D14.1(C) D15.1(C) U39.8(VDD)
$13N395: CARD1.1(DAT2) R91.2 U18.1(I/O) U18.10(NC)
$13N563: CARD1.2(CD/DAT3) R92.2 U18.2(I/O)
$13N661: CARD1.3(CMD) R93.2 U18.4(I/O)
$13N1149: CARD1.7(DAT0) R95.2 U17.2(I/O)
$13N1155: CARD1.8(DAT1) R96.2 U17.4(I/O)
$13N1161: CARD1.CD R97.2 U17.5(I/O)
$13N1194: CARD1.5(CLX) R94.2 U17.1(I/O) U17.10(NC)
$13N2058: R100.1 USB1.A5(CC1)
$13N2099: R104.1 USB1.B5(CC2)
$13N2376: R101.2 U19.1(UD+)
$13N2454: R102.2 U19.2(UD-)
$13N2482: D11.1(C) U19.8(TXD)
$13N2691: R103.1 U19.9(RXD)

Not connected (* = marked no-connect by the designer): CARD2 C6(Vpp)*; U17 6(NC) 7(NC) 9(NC); U18 5(I/O) 6(NC) 7(NC) 9(NC); U19 3(GND) 4(RTS#) 5(CTS#) 6(TNOW) 10(V3); U20 4(I/O) 5(I/O) 6(NC) 7(NC); U39 3(INT#)* 7(CLKOUT)*; U40 2(ANT)*; U43 2(RSV)* 3(RSV)* 4(RSV)* 5(RSV)* 6(RSV)* 8(RSV)* 9(ADC0)* 16(NETLIGHT)* 17(UART0_RXD)* 18(UART0_TXD)* 19(UART0_DTR)* 20(UART0_RI)* 21(UART0_DCD)* 22(UART0_CTS)* 23(UART0_RTS)* 24(VDD_EXT)* 26(RSV)* 28(UART1_RXD)* 29(UART1_TXD)* 30(RSV)* 31(RSV)* 32(RSV)* 33(PCM_OUT)* 44(RSV)* 49(WAKEUPOUT)* 50(RSV)* 51(RSV)* 52(RSV)* 53(RSV)* 54(RSV)* 55(RSV)* 56(RSV)* 57(RSV)* 58(RSV)* 61(USB_VBUS)* 62(RSV)* 63(RSV)* 64(RSV)* 65(RSV)* 66(RSV)* 67(RSV)* 68(RSV)* 69(RSV)* 74(PWM0)* 75(PWM1)* 76(GPIO0)* 77(GPIO1)* 78(RSV)* 79(USIM_DET)* 80(RSV)* 81(RSV)* 82(BOOT_MODE)* 83(RSV)* 84(RSV)* 85(RSV)* 86(GPIO2)* 87(GPIO3)* 96(ADC1)* 97(RSV)* 98(RSV)* 99(RSV)* 100(RSV)* 101(RSV)* 102(RSV)* 103(RSV)* 104(RSV)* 105(RSV)* 106(RSV)* 107(RSV)* 108(RSV)* 109(RSV)*; U44 5(I/O) 6(NC); USB1 A8(SBU1)* B8(SBU2)*

## Notes on the sheets
sheet 11
- 星闪模组 WIFI BT SIE
- RTC
- 4G模组电源
- ML307R-DC/DL
- 4G SIM卡槽
- 4G模组状态指示灯
sheet 12
- SD卡
- USB转串口调试接口
